# Altium schematic sheet Top_Sheet.SchDoc
size A4; DocumentNumber: 4; SheetNumber: 4; SheetTotal: 4
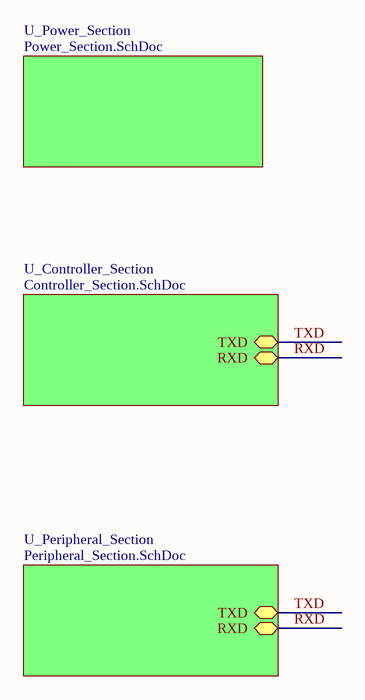
[diagram p0: Top_Sheet.SchDoc]

## Sub-sheets
U_Controller_Section = Controller_Section.SchDoc: TXD (bidir), RXD (bidir)
U_Peripheral_Section = Peripheral_Section.SchDoc: TXD (bidir), RXD (bidir)
U_Power_Section = Power_Section.SchDoc: no entries

## Nets
RXD: sheet U_Controller_Section/RXD, sheet U_Peripheral_Section/RXD
TXD: sheet U_Controller_Section/TXD, sheet U_Peripheral_Section/TXD